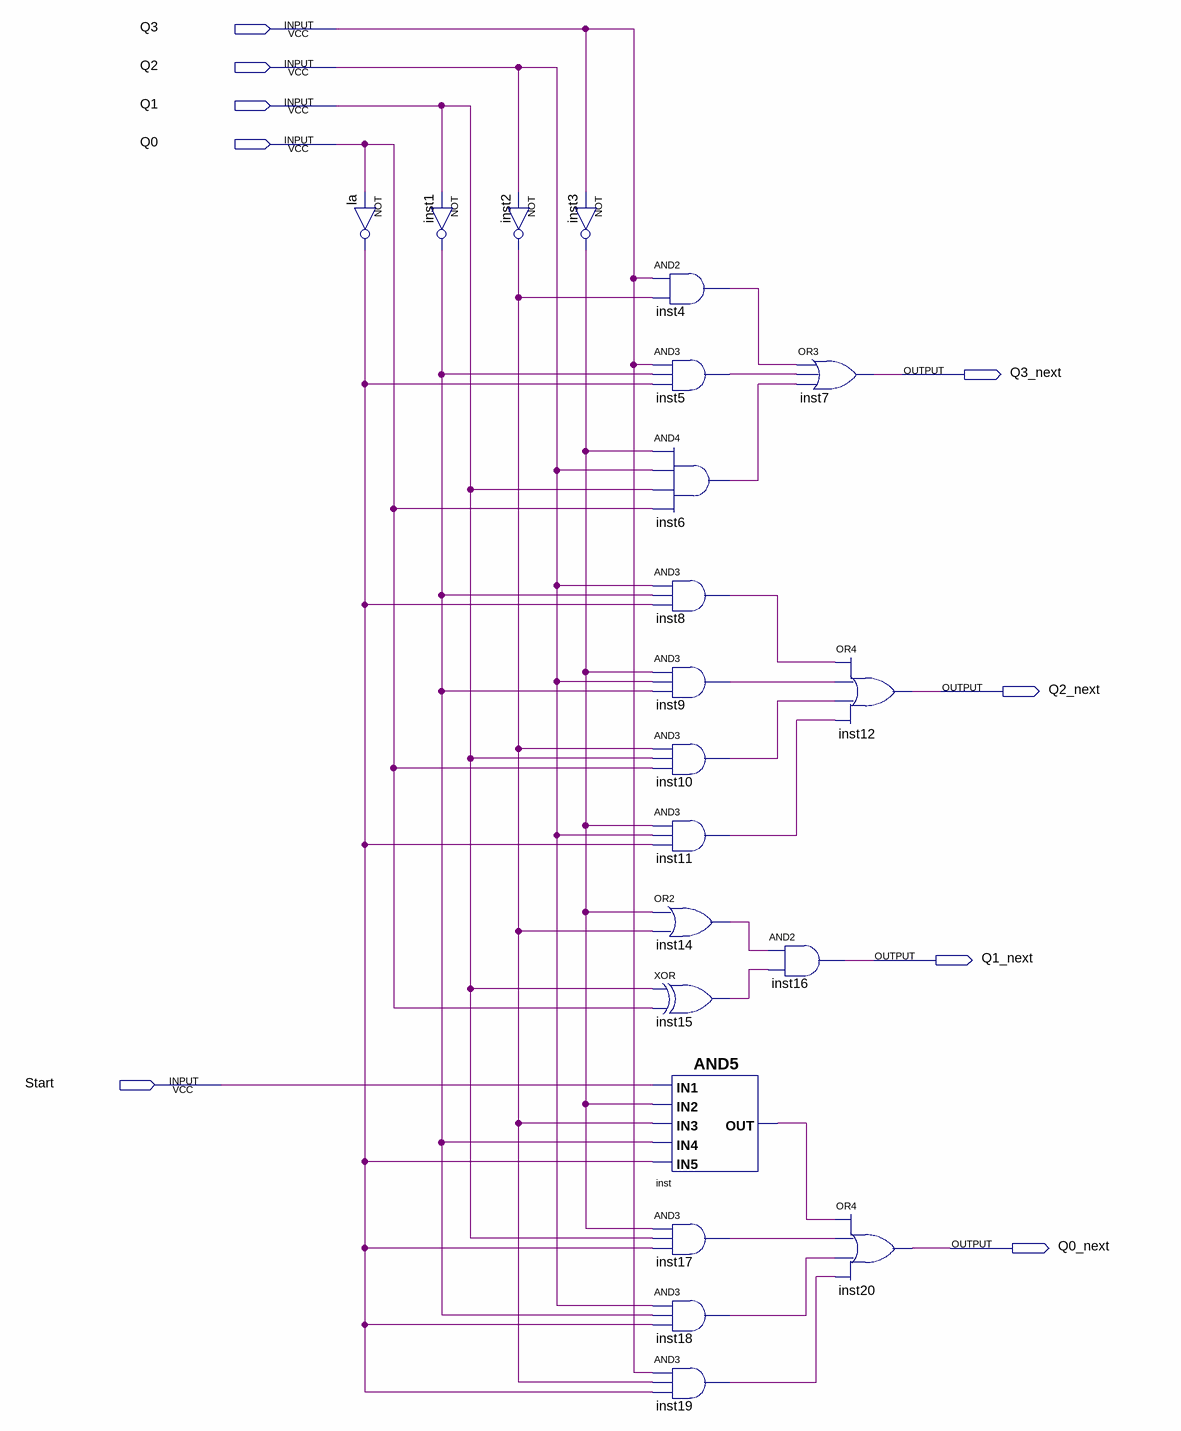
[diagram p0: schematic sheet]
// Quartus schematic next_state.bdf as structural Verilog: 21 symbols, 9 pins
module next_state (
  input  Q3,
  input  Q2,
  input  Q1,
  input  Q0,
  input  Start,
  output Q3_next,
  output Q2_next,
  output Q1_next,
  output Q0_next
);

  wire inst1_out, inst2_out, inst3_out, inst4_out, inst5_out, inst6_out, inst8_out, inst9_out, inst10_out,
       inst11_out, inst14_out, inst15_out, inst17_out, inst18_out, inst19_out, inst_out, la_out;

  not la (la_out, Q0);
  not inst1 (inst1_out, Q1);
  not inst2 (inst2_out, Q2);
  not inst3 (inst3_out, Q3);
  and inst4 (inst4_out, Q3, inst2_out);
  and inst5 (inst5_out, Q3, inst1_out, la_out);
  and inst6 (inst6_out, inst3_out, Q2, Q1, Q0);
  and inst8 (inst8_out, Q2, inst1_out, la_out);
  and inst9 (inst9_out, inst3_out, Q2, inst1_out);
  and inst10 (inst10_out, inst2_out, Q1, Q0);
  and inst11 (inst11_out, inst3_out, Q2, la_out);
  or inst14 (inst14_out, inst3_out, inst2_out);
  xor inst15 (inst15_out, Q1, Q0);
  and inst (inst_out, Start, inst3_out, inst2_out, inst1_out, la_out);
  and inst17 (inst17_out, inst3_out, Q1, la_out);
  and inst18 (inst18_out, Q2, inst1_out, la_out);
  and inst19 (inst19_out, Q3, inst2_out, la_out);
  or inst7 (Q3_next, inst4_out, inst5_out, inst6_out);
  and inst16 (Q1_next, inst14_out, inst15_out);
  or inst12 (Q2_next, inst8_out, inst9_out, inst10_out, inst11_out);
  or inst20 (Q0_next, inst_out, inst17_out, inst18_out, inst19_out);
endmodule
